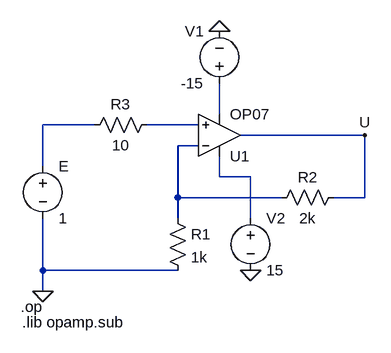
[diagram p0: schematic DC_wzm_op_rzecz.asc]
DC_wzm_op_rzecz.asc, the LTspice schematic file:
Version 4
SHEET 1 880 680
WIRE 208 16 208 -32
WIRE 16 32 -64 32
WIRE 176 32 96 32
WIRE 432 48 240 48
WIRE 176 64 144 64
WIRE -64 96 -64 32
WIRE 208 112 208 80
WIRE 256 112 208 112
WIRE 144 144 144 64
WIRE 304 144 144 144
WIRE 432 144 432 48
WIRE 432 144 384 144
WIRE 144 176 144 144
WIRE 256 176 256 112
WIRE -64 256 -64 176
WIRE 144 256 -64 256
WIRE -64 288 -64 256
FLAG 432 48 U
FLAG -64 288 0
FLAG 208 -112 0
FLAG 256 256 0
SYMBOL res 128 160 R0
SYMATTR InstName R1
SYMATTR Value 1k
SYMBOL res 400 128 R90
WINDOW 0 0 56 VBottom 2
WINDOW 3 32 56 VTop 2
SYMATTR InstName R2
SYMATTR Value 2k
SYMBOL res 112 16 R90
WINDOW 0 0 56 VBottom 2
WINDOW 3 32 56 VTop 2
SYMATTR InstName R3
SYMATTR Value 10
SYMBOL voltage -64 80 R0
WINDOW 123 0 0 Left 0
WINDOW 39 0 0 Left 0
SYMATTR InstName E
SYMATTR Value 1
SYMBOL Opamps\\OP07 208 112 M180
SYMATTR InstName U1
SYMBOL voltage 208 -16 R180
WINDOW 0 24 96 Left 2
WINDOW 3 24 16 Left 2
WINDOW 123 0 0 Left 0
WINDOW 39 0 0 Left 0
SYMATTR InstName V1
SYMATTR Value -15
SYMBOL voltage 256 160 R0
WINDOW 123 0 0 Left 0
WINDOW 39 0 0 Left 0
SYMATTR InstName V2
SYMATTR Value 15
TEXT -98 312 Left 2 !.op
TEXT -96 336 Left 2 !.lib opamp.sub

The netlist it stands for:
* DC_wzm_op_rzecz.asc
R1 N004 0 1k
R2 U N004 2k
R3 N003 N002 10
V§E N002 0 1
XU1 N003 N004 N005 N001 U LT1001  ; OP07, pins In+ In- V+ V- OUT
V1 N001 0 -15
V2 N005 0 15
.op
.lib opamp.sub
.lib LTC.lib
.backanno
.end